# Altium project Alim_SDK_hex_pcb.PrjPcb
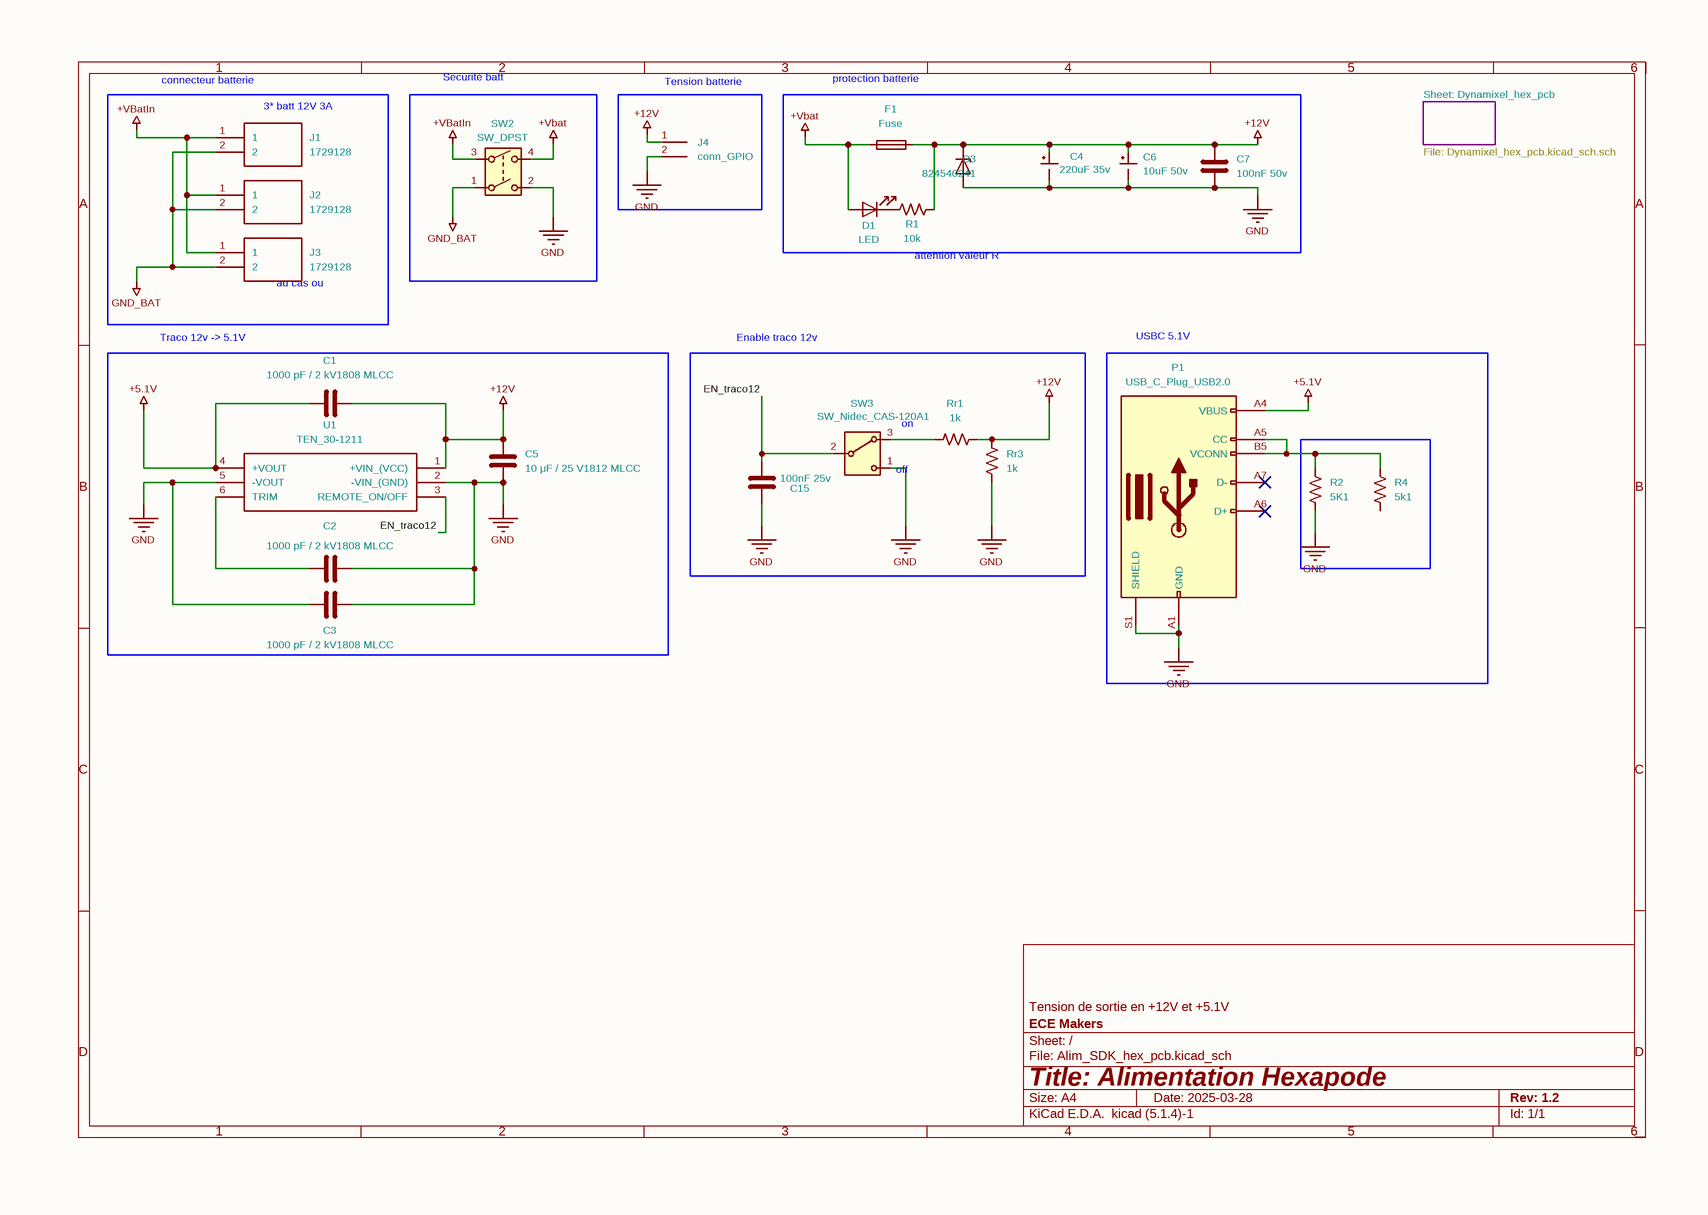
[diagram p0: Alim_SDK_hex_pcb.SchDoc]
2 sheets, 41 parts. Net scope: global (net labels, ports and power ports of the same name join across sheets).
Sheets:
  Alim_SDK_hex_pcb.SchDoc
    Dynamixel_hex_pcb = Dynamixel_hex_pcb.SchDoc

## Sheet Alim_SDK_hex_pcb.SchDoc
size 297 x 209 mm

### Parts
C1  1000 pF / 2 kV1808 MLCC  [C_0603_1608Metric]
C2  1000 pF / 2 kV1808 MLCC  [C_0603_1608Metric]
C3  1000 pF / 2 kV1808 MLCC  [C_0603_1608Metric]
C4  220uF 35v  [CP_Wurth_WCAP-HSG5-D8L10.5]
C5  10 μF / 25 V1812 MLCC  [C_0603_1608Metric]
C6  10uF 50v  [CP_Wurth_WCAP-HSG5-D5L5.8]
C7  100nF 50v  [C_0603_1608Metric]
C15  100nF 25v  [C_0603_1608Metric]
D1  LED  [LED_0603_1608Metric_Pad1.05x0.95mm_HandSolder]
D3  824540241  [D_0603_1608Metric]
F1  Fuse
J1  1729128  [691250610002]
J2  1729128  [691250610002]
J3  1729128  [691250610002]
J4  conn_GPIO  [PinHeader_1x02_P2.54mm_Vertical]
P1  USB_C_Plug_USB2.0
R1  10k  [R_0603_1608Metric_Pad0.98x0.95mm_HandSolder]
R2  5K1  [R_0201_0603Metric]
R4  5k1  [R_0201_0603Metric]
Rr1  1k  [R_0201_0603Metric]
Rr3  1k  [R_0201_0603Metric]
SW2  SW_DPST
SW3  SW_Nidec_CAS-120A1  [SW_Slide_SPDT_Straight_CK_OS102011MS2Q]
U1  TEN_30-1211  [Converter_DCDC_TRACO_THN30-xxxx_THT]

### Blocks framed on the sheet
Securité batt: SW2
Tension batterie: J4
protection batterie: C4 C6 C7 D1 D3 F1 R1
Traco 12v -> 5.1V: C1-C3 C5 U1
USBC 5.1V /: P1 R2 R4

### Sub-sheets
Dynamixel_hex_pcb = Dynamixel_hex_pcb.SchDoc: no entries

### Nets
+5.1V: C1.1 P1.A4(VBUS) U1.4(+VOUT)
+12V: C1.2 C4.1 C5.1 C6.1 C7.1 D3.1(K) F1.2 J4.1(Pin_1) R1.2 Rr1.2 Rr3.2 U1.1(+VIN_(VCC))
+Vbat: D1.2(A) F1.1 SW2.4
+VBatIn: J1.1 J2.1 J3.1 SW2.3
GND: C2.2 C3.1 C3.2 C4.2 C5.2 C6.2 C7.2 C15.2 D3.2(A) J4.2(Pin_2) P1.A1(GND) P1.S1(SHIELD) R2.2 Rr3.1 SW2.2 SW3.1(C) U1.2(-VIN_(GND)) U1.5(-VOUT)
GND_BAT: J1.2 J2.2 J3.2 SW2.1
EN_traco12: C15.1 SW3.2(B) U1.3(REMOTE_ON/OFF)
NetC2_1: C2.1 U1.6(TRIM)
NetD1_1: D1.1(K) R1.1
NetP1_A5: P1.A5(CC) P1.B5(VCONN) R2.1 R4.1
NetRr1_1: Rr1.1 SW3.3(A)

Not connected (* = marked no-connect by the designer): P1 A6(D+)* A7(D-)* A9(VBUS) A12(GND) B1(GND) B4(VBUS) B9(VBUS) B12(GND); R4 2

### Notes on the sheet
- (near J1) connecteur batterie
- (near J1) 3* batt 12V 3A
- File: Dynamixel_hex_pcb.kicad_sch.sch
- Sheet: Dynamixel_hex_pcb
- (near J3) au cas ou
- attention valeur R
- Enable traco 12v
- on
- (near SW3) off
- 1
- 2
- 3
- 4
- 5
- 6
- A
- B
- C
- Tension de sortie en +12V et +5.1V
- D
- Title: Alimentation Hexapode
- File: Alim_SDK_hex_pcb.kicad_sch
- Sheet: /
- ECE Makers
- KiCad E.D.A.  kicad (5.1.4)-1
- Size: A4
- Date: 2025-03-28
- Rev: 1.2
- Id: 1/1

### Library data of the parts
C1-C3 C5 C7 C15 = C: Description: Unpolarized capacitor; Footprint: Capacitor_SMD:C_0603_1608Metric
  C1-C3: Value: 1000 pF / 2 kV1808 MLCC
  C5: Value: 10 μF / 25 V1812 MLCC
  C7: Value: 100nF 50v
  C15: Value: 100nF 25v
C4 C6 = C_Polarized_Small_US: Description: Polarized capacitor, small US symbol
  C4: Value: 220uF 35v; Footprint: footprints:CP_Wurth_WCAP-HSG5-D8L10.5
  C6: Value: 10uF 50v; Footprint: footprints:CP_Wurth_WCAP-HSG5-D5L5.8
D1 = LED: Description: Light emitting diode; Value: LED; Footprint: LED_SMD:LED_0603_1608Metric_Pad1.05x0.95mm_HandSolder
D3 = D_Zener: Description: Zener diode; Value: 824540241; Footprint: Diode_SMD:D_0603_1608Metric
J1-J3 = 1729128: Manufacturer_Name: Phoenix Contact; Description: PCB terminal block, nominal current: 13.5 A, rated voltage (III/2): 400 V, nominal cross section: 1.5 mm?, Number of potentials: 2, Number of rows: 1, Number of positions per row: 2, product range: MKDSN 1,5, pitch: 5.08 mm, connection method: Screw connection with tension sleeve, mounting: Wave soldering, conductor/PCB connection direction: 0 ?, color: green, Pin layout: Linear pinning, Solder pin [P]: 3.5 mm, type of packaging: packed in cardboard; Height: 10.15; Mouser Part Number: 651-1729128; Mouser Price/Stock: https://www.mouser.co.uk/ProductDetail/Phoenix-Contact/1729128?qs=GFUSqQMLmmnCBVBY3dts9w%3D%3D; Manufacturer_Part_Number: 1729128; Value: 1729128; Footprint: footprints:691250610002
J4 = Conn_01x02_Socket: Description: Generic connector, single row, 01x02, script generated; Value: conn_GPIO; Footprint: Connector_PinHeader_2.54mm:PinHeader_1x02_P2.54mm_Vertical
P1 = USB_C_Plug_USB2.0: Description: USB 2.0-only Type-C Plug connector; Value: USB_C_Plug_USB2.0
R1 R2 R4 Rr1 Rr3 = R_US: Description: Resistor, US symbol
  R1: Value: 10k; Footprint: Resistor_SMD:R_0603_1608Metric_Pad0.98x0.95mm_HandSolder
  R2: Value: 5K1; Footprint: Resistor_SMD:R_0201_0603Metric
  R4: Value: 5k1; Footprint: Resistor_SMD:R_0201_0603Metric
  Rr1 Rr3: Value: 1k; Footprint: Resistor_SMD:R_0201_0603Metric
SW2 = SW_DPST: Description: Double Pole Single Throw (DPST) Switch; Value: SW_DPST
SW3 = SW_Nidec_CAS-120A1: Description: Switch, single pole double throw; Value: SW_Nidec_CAS-120A1; Footprint: Button_Switch_THT:SW_Slide_SPDT_Straight_CK_OS102011MS2Q
U1 = TEN_30-1211: Manufacturer_Name: Traco Power; Manufacturer_Part_Number: TEN 30-1211; Description: 30 Watt DC/DC converter, industrial, 2:1 input, encapsulated, 2" x 1" metal package; Mouser Part Number: 495-TEN30-1211; Mouser Price/Stock: https://www.mouser.co.uk/ProductDetail/TRACO-Power/TEN-30-1211?qs=ckJk83FOD0WBTiFxQgpG7A%3D%3D; Value: TEN_30-1211; Footprint: Converter_DCDC:Converter_DCDC_TRACO_THN30-xxxx_THT
F1 = Fuse: Description: Fuse; Value: Fuse

## Sheet Dynamixel_hex_pcb.SchDoc
size 297 x 209 mm
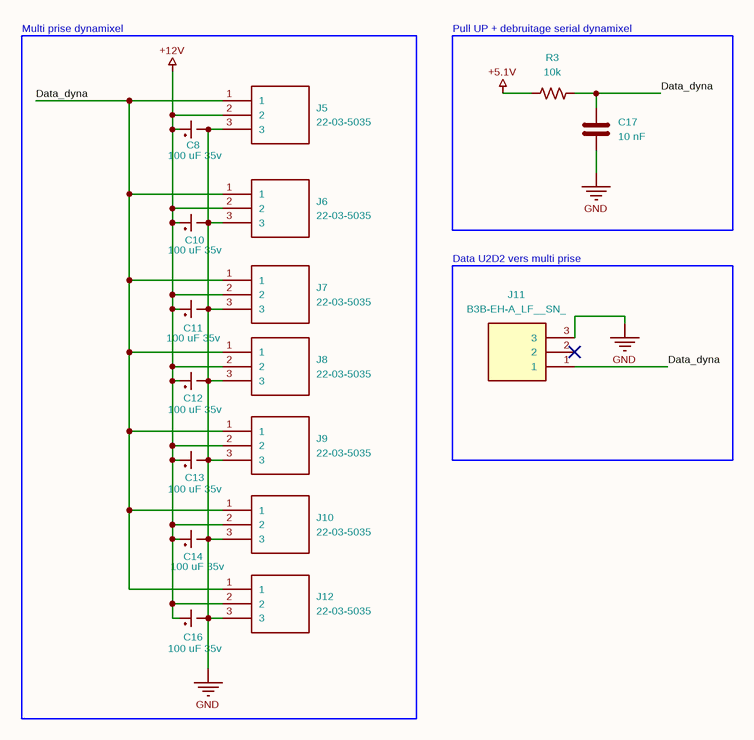
[diagram p1: Dynamixel_hex_pcb.SchDoc]

### Parts
C8  100 uF 35v  [CP_Wurth_WCAP-HSG5-D6.3L7.7]
C10  100 uF 35v  [CP_Wurth_WCAP-HSG5-D6.3L7.7]
C11  100 uF 35v  [CP_Wurth_WCAP-HSG5-D6.3L7.7]
C12  100 uF 35v  [CP_Wurth_WCAP-HSG5-D6.3L7.7]
C13  100 uF 35v  [CP_Wurth_WCAP-HSG5-D6.3L7.7]
C14  100 uF 35v  [CP_Wurth_WCAP-HSG5-D6.3L7.7]
C16  100 uF 35v  [CP_Wurth_WCAP-HSG5-D6.3L7.7]
C17  10 nF  [C_0603_1608Metric]
J5  22-03-5035  [Molex_SPOX_5267-03A_1x03_P2.50mm_Vertical]
J6  22-03-5035  [Molex_SPOX_5267-03A_1x03_P2.50mm_Vertical]
J7  22-03-5035  [Molex_SPOX_5267-03A_1x03_P2.50mm_Vertical]
J8  22-03-5035  [Molex_SPOX_5267-03A_1x03_P2.50mm_Vertical]
J9  22-03-5035  [Molex_SPOX_5267-03A_1x03_P2.50mm_Vertical]
J10  22-03-5035  [Molex_SPOX_5267-03A_1x03_P2.50mm_Vertical]
J11  B3B-EH-A_LF__SN_  [JST_EH_B3B-EH-A_1x03_P2.50mm_Vertical]
J12  22-03-5035  [Molex_SPOX_5267-03A_1x03_P2.50mm_Vertical]
R3  10k  [R_0201_0603Metric]

### Blocks framed on the sheet
Multi prise dynamixel: C8 C10-C14 C16 J5-J10 J12
Pull UP + debruitage serial dynamixel: C17 R3
Data U2D2 vers multi prise: J11

### Nets
+5.1V: R3.1
+12V: C8.1 C10.1 C11.1 C12.1 C13.1 C14.1 C16.1 J5.2 J6.2 J7.2 J8.2 J9.2 J10.2 J12.2
GND: C8.2 C10.2 C11.2 C12.2 C13.2 C14.2 C16.2 C17.2 J5.3 J6.3 J7.3 J8.3 J9.3 J10.3 J11.3 J12.3
Data_dyna: C17.1 J5.1 J6.1 J7.1 J8.1 J9.1 J10.1 J11.1 J12.1 R3.2

Not connected (* = marked no-connect by the designer): J11 2*

### Notes on the sheet
- 1
- 2
- 3
- 4
- 5
- 6
- A
- B
- C
- Multiprise Dynamixel + Data U2D2
- D
- Title: Dynamixel Hexapode
- File: Dynamixel_hex_pcb.kicad_sch
- Sheet: /
- ECE Makers
- KiCad E.D.A.  kicad (5.1.4)-1
- Size: A4
- Date: 2025-03-28
- Rev: 1.1
- Id: 1/1

### Library data of the parts
C8 C10-C14 C16 = C_Polarized_Small_US: Value: 100 uF 35v; Footprint: footprints:CP_Wurth_WCAP-HSG5-D6.3L7.7
C17 = C: Value: 10 nF; Footprint: Capacitor_SMD:C_0603_1608Metric
J5-J10 J12 = 22-03-5035: Manufacturer_Name: Molex; Height: 5.9; Mouser Part Number: 538-22-03-5035; Mouser Price/Stock: https://www.mouser.co.uk/ProductDetail/Molex/22-03-5035?qs=VKrXD49J9Ep%252Bv2WwbOoiPA%3D%3D; Manufacturer_Part_Number: 22-03-5035; Value: 22-03-5035; Footprint: Connector_Molex:Molex_SPOX_5267-03A_1x03_P2.50mm_Vertical
J11 = B3B-EH-A_LF__SN_: Manufacturer_Name: JST (JAPAN SOLDERLESS TERMINALS); Manufacturer_Part_Number: B3B-EH-A(LF)(SN); Height: 6; Mouser Part Number: 306-B3BEHALFSNP; Mouser Price/Stock: https://www.mouser.co.uk/ProductDetail/JST-Commercial/B3B-EH-ALFSN?qs=cdbOS8ANM9BrLnX9Tj37TA%3D%3D; Value: B3B-EH-A_LF__SN_; Footprint: Connector_JST:JST_EH_B3B-EH-A_1x03_P2.50mm_Vertical
R3 = R_US: Value: 10k; Footprint: Resistor_SMD:R_0201_0603Metric

## Nets that join several sheets
+5.1V: Alim_SDK_hex_pcb (C1.1 P1.A4 U1.4), Dynamixel_hex_pcb (R3.1)
+12V: Alim_SDK_hex_pcb (12 pins), Dynamixel_hex_pcb (14 pins)
GND: Alim_SDK_hex_pcb (18 pins), Dynamixel_hex_pcb (16 pins)